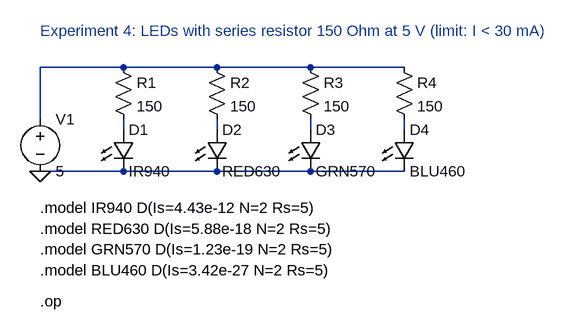
[diagram p0: schematic LED_Vorwiderstand_Arbeitspunkt.asc]
LED_Vorwiderstand_Arbeitspunkt.asc, the LTspice schematic file:
Version 4.1
SHEET 1 880 480
WIRE 80 80 208 80
WIRE 208 80 352 80
WIRE 352 80 496 80
WIRE 496 80 640 80
WIRE 80 80 80 160
WIRE 80 240 208 240
WIRE 208 240 352 240
WIRE 352 240 496 240
WIRE 496 240 640 240
WIRE 208 160 208 176
WIRE 352 160 352 176
WIRE 496 160 496 176
WIRE 640 160 640 176
FLAG 80 240 0
SYMBOL voltage 80 144 R0
SYMATTR InstName V1
SYMATTR Value 5
SYMBOL res 192 64 R0
SYMATTR InstName R1
SYMATTR Value 150
SYMBOL LED 192 176 R0
SYMATTR InstName D1
SYMATTR Value IR940
SYMBOL res 336 64 R0
SYMATTR InstName R2
SYMATTR Value 150
SYMBOL LED 336 176 R0
SYMATTR InstName D2
SYMATTR Value RED630
SYMBOL res 480 64 R0
SYMATTR InstName R3
SYMATTR Value 150
SYMBOL LED 480 176 R0
SYMATTR InstName D3
SYMATTR Value GRN570
SYMBOL res 624 64 R0
SYMATTR InstName R4
SYMATTR Value 150
SYMBOL LED 624 176 R0
SYMATTR InstName D4
SYMATTR Value BLU460
TEXT 80 24 Left 2 ;Experiment 4: LEDs with series resistor 150 Ohm at 5 V (limit: I < 30 mA)
TEXT 80 296 Left 2 !.model IR940 D(Is=4.43e-12 N=2 Rs=5)
TEXT 80 328 Left 2 !.model RED630 D(Is=5.88e-18 N=2 Rs=5)
TEXT 80 360 Left 2 !.model GRN570 D(Is=1.23e-19 N=2 Rs=5)
TEXT 80 392 Left 2 !.model BLU460 D(Is=3.42e-27 N=2 Rs=5)
TEXT 80 440 Left 2 !.op

The netlist it stands for:
* LED_Vorwiderstand_Arbeitspunkt.asc
V1 N001 0 5
R1 N001 N002 150
D1 N002 0 IR940
R2 N001 N003 150
D2 N003 0 RED630
R3 N001 N004 150
D3 N004 0 GRN570
R4 N001 N005 150
D4 N005 0 BLU460
.model D D
.lib standard.dio
* Experiment 4: LEDs with series resistor 150 Ohm at 5 V (limit: I < 30 mA)
.model IR940 D(Is=4.43e-12 N=2 Rs=5)
.model RED630 D(Is=5.88e-18 N=2 Rs=5)
.model GRN570 D(Is=1.23e-19 N=2 Rs=5)
.model BLU460 D(Is=3.42e-27 N=2 Rs=5)
.op
.backanno
.end